# Altium project Sampler.PrjPCB (part 5 of 5)

## Sheet Drivers.SchDoc: =DocumentName
size A3; Version: 3.0.0; Github: https://github.com/sinara-hw/Sampler; Last modified by: Krzysztof Belewicz; DocumentNumber: 1; Revision: 0; SheetNumber: 1; SheetTotal: 1
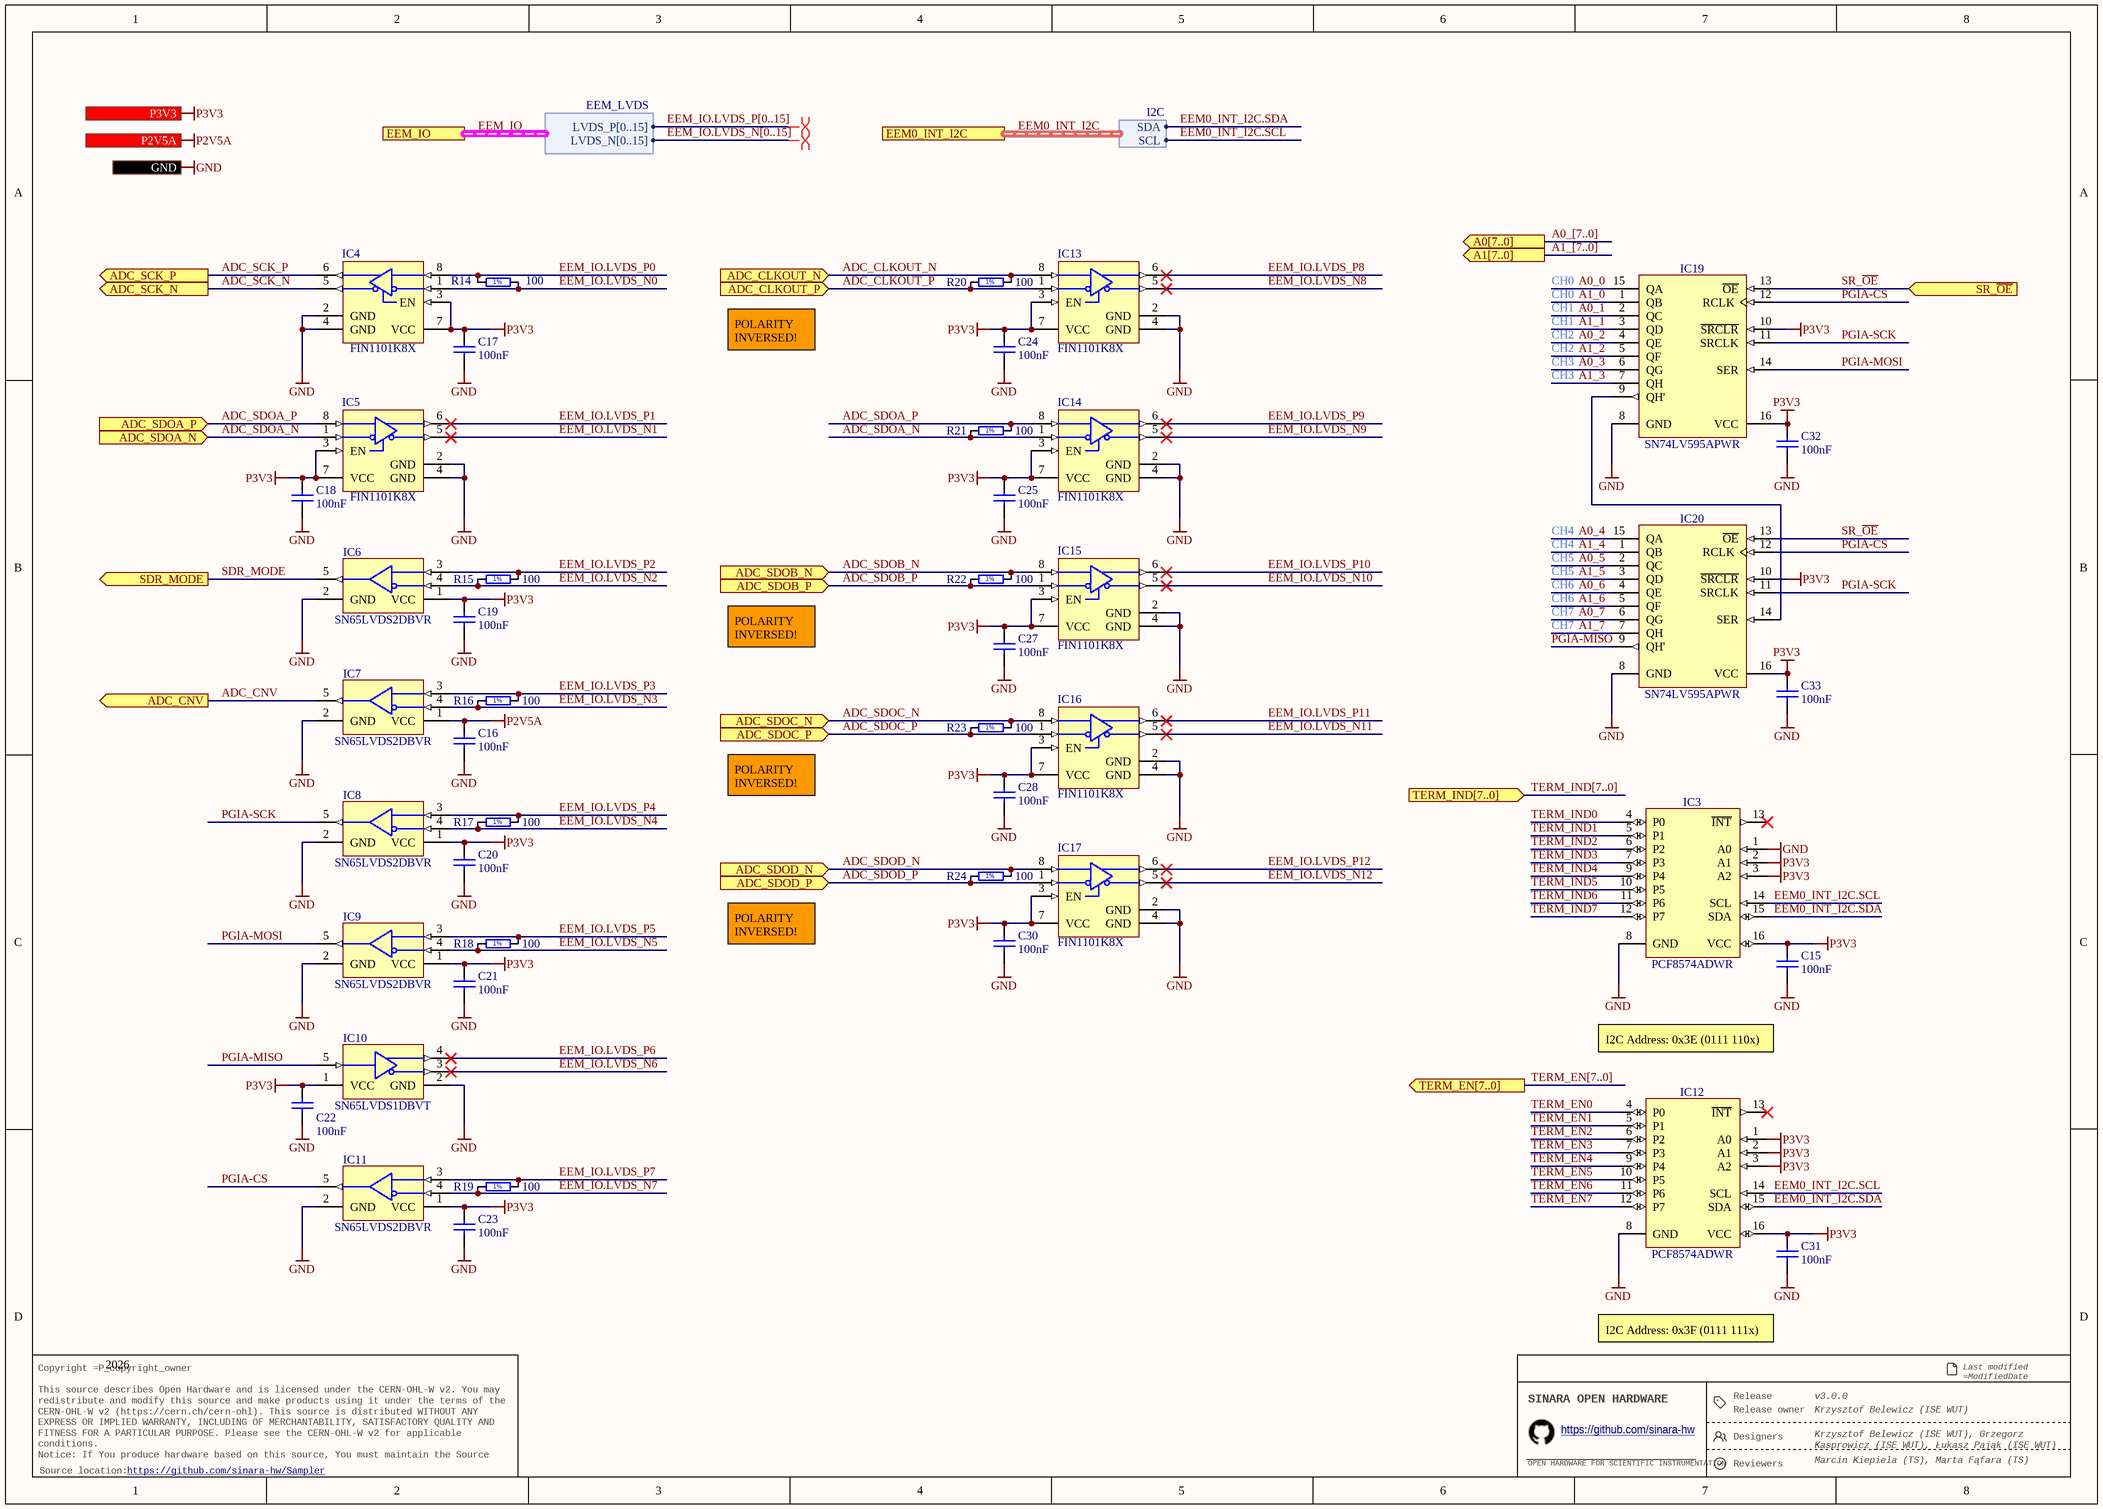
[diagram p13: Drivers.SchDoc]

### Parts
C15  100nF  [CAPC1005X55N]
C16  100nF  [CAPC1005X55N]
C17  100nF  [CAPC1005X55N]
C18  100nF  [CAPC1005X55N]
C19  100nF  [CAPC1005X55N]
C20  100nF  [CAPC1005X55N]
C21  100nF  [CAPC1005X55N]
C22  100nF  [CAPC1005X55N]
C23  100nF  [CAPC1005X55N]
C24  100nF  [CAPC1005X55N]
C25  100nF  [CAPC1005X55N]
C27  100nF  [CAPC1005X55N]
C28  100nF  [CAPC1005X55N]
C30  100nF  [CAPC1005X55N]
C31  100nF  [CAPC1005X55N]
C32  100nF  [CAPC1005X55N]
C33  100nF  [CAPC1005X55N]
IC3  PCF8574ADWR  [SOIC127P1030X265-16N]
IC4  FIN1101K8X  [SOP50P310X90-8N]
IC5  FIN1101K8X  [SOP50P310X90-8N]
IC6  SN65LVDS2DBVR  [SOT95P280X145-5N]
IC7  SN65LVDS2DBVR  [SOT95P280X145-5N]
IC8  SN65LVDS2DBVR  [SOT95P280X145-5N]
IC9  SN65LVDS2DBVR  [SOT95P280X145-5N]
IC10  SN65LVDS1DBVT  [SOT95P280X145-5N]
IC11  SN65LVDS2DBVR  [SOT95P280X145-5N]
IC12  PCF8574ADWR  [SOIC127P1030X265-16N]
IC13  FIN1101K8X  [SOP50P310X90-8N]
IC14  FIN1101K8X  [SOP50P310X90-8N]
IC15  FIN1101K8X  [SOP50P310X90-8N]
IC16  FIN1101K8X  [SOP50P310X90-8N]
IC17  FIN1101K8X  [SOP50P310X90-8N]
IC19  SN74LV595APWR  [SOP65P640X120-16N]
IC20  SN74LV595APWR  [SOP65P640X120-16N]
R14  100  [RESC1005X40N]
R15  100  [RESC1005X40N]
R16  100  [RESC1005X40N]
R17  100  [RESC1005X40N]
R18  100  [RESC1005X40N]
R19  100  [RESC1005X40N]
R20  100  [RESC1005X40N]
R21  100  [RESC1005X40N]
R22  100  [RESC1005X40N]
R23  100  [RESC1005X40N]
R24  100  [RESC1005X40N]

### Ports
A0[7..0] (out), A1[7..0] (out), ADC_CLKOUT_N (in), ADC_CLKOUT_P (in), ADC_CNV (out), ADC_SCK_N (out), ADC_SCK_P (out), ADC_SDOA_N (in), ADC_SDOA_P (in), ADC_SDOB_N (in), ADC_SDOB_P (in), ADC_SDOC_N (in), ADC_SDOC_P (in), ADC_SDOD_N (in), ADC_SDOD_P (in), EEM0_INT_I2C (harness I2C), EEM_IO (harness EEM_LVDS), GND, P2V5A (in), P3V3 (in), SDR_MODE (out), SR_~{OE} (in), TERM_EN[7..0] (out), TERM_IND[7..0] (in)

### Harnesses
EEM_LVDS: LVDS_P[0..15], LVDS_N[0..15]
I2C: SDA, SCL

### Nets
GND: C15.1 C16.1 C17.1 C18.1 C19.1 C20.1 C21.1 C22.1 C23.1 C24.1 C25.1 C27.1 C28.1 C30.1 C31.1 C32.1 C33.1 IC3.1(A0) IC3.8(GND) IC4.2(GND) IC4.4(GND) IC5.2(GND) IC5.4(GND) IC6.2(GND) IC7.2(GND) IC8.2(GND) IC9.2(GND) IC10.2(GND) IC11.2(GND) IC12.8(GND) IC13.2(GND) IC13.4(GND) IC14.2(GND) IC14.4(GND) IC15.2(GND) IC15.4(GND) IC16.2(GND) IC16.4(GND) IC17.2(GND) IC17.4(GND) IC19.8(GND) IC20.8(GND) ; port GND
P2V5A: C16.2 IC7.1(VCC) ; port P2V5A
P3V3: C15.2 C17.2 C18.2 C19.2 C20.2 C21.2 C22.2 C23.2 C24.2 C25.2 C27.2 C28.2 C30.2 C31.2 C32.2 C33.2 IC3.2(A1) IC3.3(A2) IC3.16(VCC) IC4.3(EN) IC4.7(VCC) IC5.3(EN) IC5.7(VCC) IC6.1(VCC) IC8.1(VCC) IC9.1(VCC) IC10.1(VCC) IC11.1(VCC) IC12.1(A0) IC12.2(A1) IC12.3(A2) IC12.16(VCC) IC13.3(EN) IC13.7(VCC) IC14.3(EN) IC14.7(VCC) IC15.3(EN) IC15.7(VCC) IC16.3(EN) IC16.7(VCC) IC17.3(EN) IC17.7(VCC) IC19.10(~{SRCLR}) IC19.16(VCC) IC20.10(~{SRCLR}) IC20.16(VCC) ; port P3V3
A0_0: IC19.15(QA)  [project net A00]
A0_1: IC19.2(QC)  [project net A01]
A0_2: IC19.4(QE)  [project net A02]
A0_3: IC19.6(QG)  [project net A03]
A0_4: IC20.15(QA)  [project net A04]
A0_5: IC20.2(QC)  [project net A05]
A0_6: IC20.4(QE)  [project net A06]
A0_7: IC20.6(QG)  [project net A07]
A1_0: IC19.1(QB)  [project net A10]
A1_1: IC19.3(QD)  [project net A11]
A1_2: IC19.5(QF)  [project net A12]
A1_3: IC19.7(QH)  [project net A13]
A1_4: IC20.1(QB)  [project net A14]
A1_5: IC20.3(QD)  [project net A15]
A1_6: IC20.5(QF)  [project net A16]
A1_7: IC20.7(QH)  [project net A17]
ADC_CLKOUT_N: IC13.8(RIN+) R20.2 ; port ADC_CLKOUT_N
ADC_CLKOUT_P: IC13.1(RIN-) R20.1 ; port ADC_CLKOUT_P
ADC_CNV: IC7.5(R) ; port ADC_CNV
ADC_SCK_N: IC4.5(DOUT-) ; port ADC_SCK_N
ADC_SCK_P: IC4.6(DOUT+) ; port ADC_SCK_P
ADC_SDOA_N: IC5.1(RIN-) IC14.1(RIN-) R21.1 ; port ADC_SDOA_N
ADC_SDOA_P: IC5.8(RIN+) IC14.8(RIN+) R21.2 ; port ADC_SDOA_P
ADC_SDOB_N: IC15.8(RIN+) R22.2 ; port ADC_SDOB_N
ADC_SDOB_P: IC15.1(RIN-) R22.1 ; port ADC_SDOB_P
ADC_SDOC_N: IC16.8(RIN+) R23.2 ; port ADC_SDOC_N
ADC_SDOC_P: IC16.1(RIN-) R23.1 ; port ADC_SDOC_P
ADC_SDOD_N: IC17.8(RIN+) R24.2 ; port ADC_SDOD_N
ADC_SDOD_P: IC17.1(RIN-) R24.1 ; port ADC_SDOD_P
EEM0_INT_I2C.SCL: IC3.14(SCL) IC12.14(SCL) ; port EEM0_INT_I2C.SCL
EEM0_INT_I2C.SDA: IC3.15(SDA) IC12.15(SDA) ; port EEM0_INT_I2C.SDA
EEM_IO.LVDS_N0: IC4.1(RIN-) R14.1
EEM_IO.LVDS_N1: IC5.5(DOUT-)
EEM_IO.LVDS_N2: IC6.4(B) R15.1
EEM_IO.LVDS_N3: IC7.4(B) R16.1
EEM_IO.LVDS_N4: IC8.4(B) R17.1
EEM_IO.LVDS_N5: IC9.4(B) R18.1
EEM_IO.LVDS_N6: IC10.3(A)
EEM_IO.LVDS_N7: IC11.4(B) R19.1
EEM_IO.LVDS_N8: IC13.5(DOUT-)
EEM_IO.LVDS_N9: IC14.5(DOUT-)
EEM_IO.LVDS_N10: IC15.5(DOUT-)
EEM_IO.LVDS_N11: IC16.5(DOUT-)
EEM_IO.LVDS_N12: IC17.5(DOUT-)
EEM_IO.LVDS_P0: IC4.8(RIN+) R14.2
EEM_IO.LVDS_P1: IC5.6(DOUT+)
EEM_IO.LVDS_P2: IC6.3(A) R15.2
EEM_IO.LVDS_P3: IC7.3(A) R16.2
EEM_IO.LVDS_P4: IC8.3(A) R17.2
EEM_IO.LVDS_P5: IC9.3(A) R18.2
EEM_IO.LVDS_P6: IC10.4(B)
EEM_IO.LVDS_P7: IC11.3(A) R19.2
EEM_IO.LVDS_P8: IC13.6(DOUT+)
EEM_IO.LVDS_P9: IC14.6(DOUT+)
EEM_IO.LVDS_P10: IC15.6(DOUT+)
EEM_IO.LVDS_P11: IC16.6(DOUT+)
EEM_IO.LVDS_P12: IC17.6(DOUT+)
PGIA-CS: IC11.5(R) IC19.12(RCLK) IC20.12(RCLK)
PGIA-MISO: IC10.5(R) IC20.9(QH')
PGIA-MOSI: IC9.5(R) IC19.14(SER)
PGIA-SCK: IC8.5(R) IC19.11(SRCLK) IC20.11(SRCLK)
SDR_MODE: IC6.5(R) ; port SDR_MODE
SR_~{OE}: IC19.13(~{OE}) IC20.13(~{OE}) ; port SR_~{OE}
TERM_EN0: IC12.4(P0)
TERM_EN1: IC12.5(P1)
TERM_EN2: IC12.6(P2)
TERM_EN3: IC12.7(P3)
TERM_EN4: IC12.9(P4)
TERM_EN5: IC12.10(P5)
TERM_EN6: IC12.11(P6)
TERM_EN7: IC12.12(P7)
TERM_IND0: IC3.4(P0)
TERM_IND1: IC3.5(P1)
TERM_IND2: IC3.6(P2)
TERM_IND3: IC3.7(P3)
TERM_IND4: IC3.9(P4)
TERM_IND5: IC3.10(P5)
TERM_IND6: IC3.11(P6)
TERM_IND7: IC3.12(P7)
NetIC19_9: IC19.9(QH') IC20.14(SER)

Not connected (* = marked no-connect by the designer): IC3 13(~{INT})*; IC12 13(~{INT})*

### Buses and harness runs
bus A0_[7..0] = port A0[7..0]
bus A1_[7..0] = port A1[7..0]
bus EEM_IO.LVDS_N[0..15]
bus EEM_IO.LVDS_P[0..15]
bus TERM_EN[7..0] = port TERM_EN[7..0]
bus TERM_IND[7..0] = port TERM_IND[7..0]
harness EEM0_INT_I2C = port EEM0_INT_I2C
harness EEM_IO = port EEM_IO

### Layout directives
differential pair; differential pair class Diff_100Ohm: (no net found under the mark)

### Notes on the sheet
- CH0
- CH1
- POLARITY INVERSED!
- CH2
- CH3
- CH4
- CH5
- CH6
- CH7
- I2C Address: 0x3E (0111 110x)
- 2026
- I2C Address: 0x3F (0111 111x)
- Release
- Last modified =ModifiedDate
  Sheet =sheetnumber of =sheettotal · Size A3
- Copyright =P_copyright_owner
  This source describes Open Hardware and is licensed under the CERN-OHL-W v2. You may redistribute and modify this source and make products using it under the terms of the CERN-OHL-W v2 (https://cern.ch/cern-ohl). This source is distributed WITHOUT ANY EXPRESS OR IMPLIED WARRANTY, INCLUDING OF MERCHANTABILITY, SATISFACTORY QUALITY AND FITNESS FOR A PARTICULAR PURPOSE. Please see the CERN-OHL-W v2 for applicable conditions.
  Notice: If You produce hardware based on this source, You must maintain the Source Location visible on the product, its packaging or its documentation.
- SINARA OPEN HARDWARE
- OPEN HARDWARE FOR SCIENTIFIC INSTRUMENTATION
- https://github.com/sinara-hw
- Release owner
- Designers
- Reviewers
- Source location:
- (in symbol R0402_100R_1%_0.1W_100PPM) 1%

### Library data of the parts
C15-C25 C27 C28 C30-C33 = CC0402_100NF_50V_10%_X7R: as T_C3-T_C6 on sheet EEM_Connectors; Part Number: CC0402_100NF_50V_10%_X7R; Component Kind: Standard; Component Type: Standard; Pin Count: 2; Value: 100nF; Status: None; Manufacturer Part Number: CC0402_100NF_50V_10%_X7R; Case: 0402; Mounted: Yes; Socket: No; SMD: Yes; Sense: No; Manufacturer1 Example: MURATA; Manufacturer1 ComponentHeight: 0.55mm; HelpURL: \\cern.ch\dfs\Applications\Altium\Datasheets\CC0402_MURATA_GRM155R71H104KE14D.pdf; Author: CERN DEM MR; CreateDate: 30.06.2017; LatestRevisionDate: 30.06.2017
IC3 IC12 = PCF8574ADWR: Remote 8-bit I/O Expander For I2C Bus; Manufacturer: TEXAS INSTRUMENTS; PressFit: No; Bonding: No; Part Number: PCF8574ADWR; Component Kind: Standard; Component Type: Standard; Device: PCF8574ADWR; PackageDescription: SOIC, 1.27mm Pitch; 16 Pin, 7.50mm W X 10.3mm L X 2.65mm H body, IPC Medium Density; Part Description: Remote 8-bit I/O Expander For I2C Bus; Manufacturer Part Number: PCF8574ADWR; Pin Count: 16; Case: SOIC16W; Mounted: Yes; Socket: No; SMD: Yes; Sense: No; ComponentHeight: 2.65mm; Author: CERN DEM JLC; HelpURL: \\cern.ch\dfs\Applications\Altium\Datasheets\PCF8574ADWR.pdf; CreateDate: 01/11/2012; LatestRevisionDate: 01/11/2012
IC4 IC5 IC13-IC17 = FIN1101K8X: LVDS Single Port High Speed Repeater; Manufacturer: FAIRCHILD SEMICONDUCTOR; PressFit: No; Bonding: No; Part Number: FIN1101K8X; Component Kind: Standard; Component Type: Standard; Device: FIN1101K8X; PackageDescription: SOP, 0.50mm Pitch; 8 pin, 2.30mm W X 2.00mm L X 0.90mm H body, PC Medium Density; Part Description: LVDS Single Port High Speed Repeater; Manufacturer Part Number: FIN1101K8X; Pin Count: 8; Case: TSSOP8; Mounted: Yes; Socket: No; SMD: Yes; Sense: No; ComponentHeight: 0.8mm; Author: CERN DEM JLC; HelpURL: \\cern.ch\dfs\Applications\Altium\Datasheets\FIN1101K8X.pdf; CreateDate: 08.11.2016; LatestRevisionDate: 08.11.2016
IC6-IC9 IC11 = SN65LVDS2DBVR: High-Speed Differential Line Receiver; Manufacturer: TEXAS INSTRUMENTS; PressFit: No; Bonding: No; Part Number: SN65LVDS2DBVR; Component Kind: Standard; Component Type: Standard; Device: SN65LVDS2DBVR; PackageDescription: SOT, 0.95mm pitch; 5 pin, 1.60mm W X 2.90mm L X 1.45mm H body, IPC Medium Density; Part Description: High-Speed Differential Line Receiver; Manufacturer Part Number: SN65LVDS2DBVR; Pin Count: 5; Case: SOT23-5; Mounted: Yes; Socket: No; SMD: Yes; Sense: No; ComponentHeight: 1.45mm; Author: CERN DEM JLC; HelpURL: \\cern.ch\dfs\Applications\Altium\Datasheets\SN65LVDS2DBVR.pdf; CreateDate: 03.03.2011; LatestRevisionDate: 22.09.2011
IC10 = SN65LVDS1DBVT: High-Speed Differential Line Driver; Manufacturer: TEXAS INSTRUMENTS; PressFit: No; Bonding: No; Part Number: SN65LVDS1DBVT; Component Kind: Standard; Component Type: Standard; Device: SN65LVDS1DBVT; PackageDescription: SOT, 0.95mm pitch; 5 pin, 1.60mm W X 2.90mm L X 1.45mm H body, IPC Medium Density; Part Description: High-Speed Differential Line Driver; Manufacturer Part Number: SN65LVDS1DBVT; Pin Count: 5; Case: SOT23-5; Mounted: Yes; Socket: No; SMD: Yes; Sense: No; ComponentHeight: 1.45mm; Author: CERN DEM JLC; HelpURL: \\cern.ch\dfs\Applications\Altium\Datasheets\SN65LVDS1DBVT.pdf; CreateDate: 22.09.2011; LatestRevisionDate: 22.09.2011
IC19 IC20 = SN74LV595APWR: 8-Bit Shift Register With 3-State Output Register; Part Description: 8-Bit Shift Register With 3-State Output Registers; Manufacturer: TEXAS INSTRUMENTS; PressFit: No; Bonding: No; Part Number: SN74LV595APWR; Component Kind: Standard; Component Type: Standard; Device: SN74LV595APWR; PackageDescription: SOP, 0.65mm pitch; 16 pin, 4.40mm W X 5.00mm L X 1.20mm H body IPC Medium Density; Manufacturer Part Number: SN74LV595APWR; Pin Count: 16; Case: TSSOP16; Mounted: Yes; Socket: No; SMD: Yes; Sense: No; ComponentHeight: 1.2mm; Author: CERN DEM JLC; HelpURL: \\cern.ch\dfs\Applications\Altium\Datasheets\SN74LV595APWR.pdf; CreateDate: 10/05/2012; LatestRevisionDate: 10/05/2012
R14-R24 = R0402_100R_1%_0.1W_100PPM: Resistor - 1%; Part Description: General Purpose Thick Film Chip Resistor; Manufacturer: GENERIC; Manufacturer Part Number: R0402_100R_1%_0.1W_100PPM_50V; Manufacturer1 Part Number: ERJ2RKF1000X; Power: 0.1W; TC: ±100ppm/°C; Voltage: 50V; Part Number: R0402_100R_1%_0.1W_100PPM; Component Kind: Standard; Component Type: Standard; Pin Count: 2; Value: 100; Status: Not recommended; Tolerance: ±1%; Case: 0402; Mounted: Yes; Sense: No; Socket: No; SMD: Yes; Manufacturer1 Example: PANASONIC; Manufacturer1 ComponentHeight: 0.4mm; HelpURL: \\cern.ch\dfs\Applications\Altium\Datasheets\R0402_PANASONIC_ERJ2RK.pdf; Author: CERN DEM JLC; CreateDate: 12.12.2013; LatestRevisionDate: 03.03.2015

## Sheet I2C_switch.SchDoc: =DocumentName
size A4; SPICEModelCacheVGBTAUBO: <root> / <DocumentId>VGBTAUBO</DocumentId> / </root>; Version: 3.0.0; Github: https://github.com/sinara-hw/Sampler; Last modified by: Maciej Przybysz; DocumentNumber: 1; Revision: 0; SheetNumber: 1; SheetTotal: 1
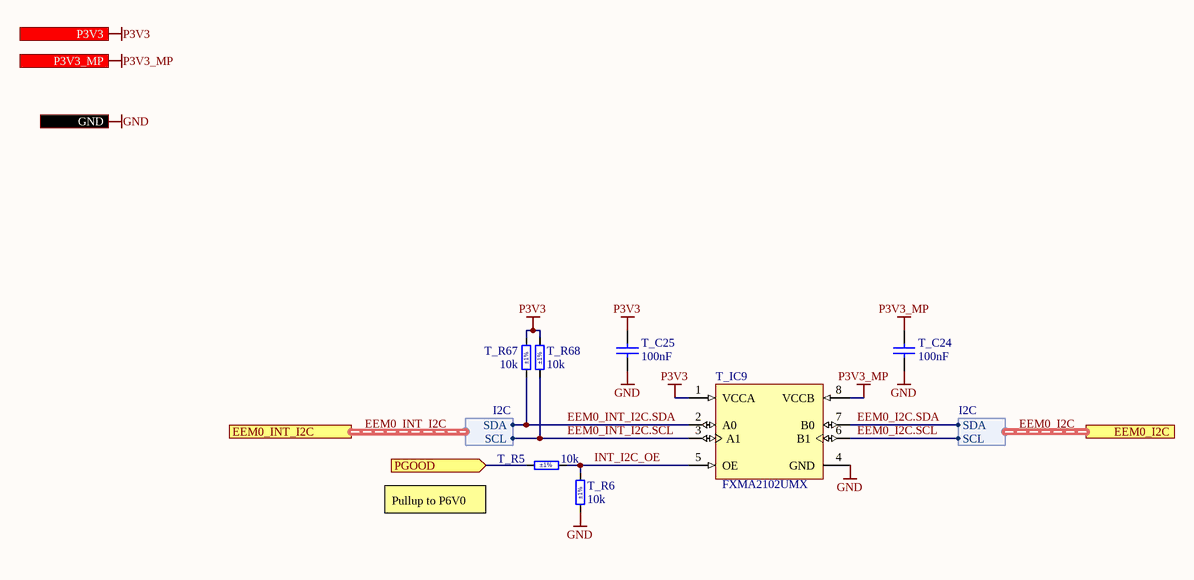
[diagram p14: I2C_switch.SchDoc]

### Parts
T_C24  100nF  [CAPC1005X55N]
T_C25  100nF  [CAPC1005X55N]
T_IC9  FXMA2102UMX  [FXMA2102UMX]
T_R5  10k  Tolerance: ±1%  [RESC1005X40N]
T_R6  10k  Tolerance: ±1%  [RESC1005X40N]
T_R67  10k  Tolerance: ±1%  [RESC1005X40N]
T_R68  10k  Tolerance: ±1%  [RESC1005X40N]

### Ports
EEM0_I2C (harness I2C), EEM0_INT_I2C (harness I2C), GND, P3V3 (in), P3V3_MP (in), PGOOD (in)

### Harnesses
I2C: SDA, SCL

### Nets
GND: T_C24.1 T_C25.1 T_IC9.4(GND) T_R6.1 ; port GND
P3V3: T_C25.2 T_IC9.1(VCCA) T_R67.2 T_R68.2 ; port P3V3
P3V3_MP: T_C24.2 T_IC9.8(VCCB) ; port P3V3_MP
EEM0_I2C.SCL: T_IC9.6(B1) ; port EEM0_I2C.SCL
EEM0_I2C.SDA: T_IC9.7(B0) ; port EEM0_I2C.SDA
EEM0_INT_I2C.SCL: T_IC9.3(A1) T_R68.1 ; port EEM0_INT_I2C.SCL
EEM0_INT_I2C.SDA: T_IC9.2(A0) T_R67.1 ; port EEM0_INT_I2C.SDA
INT_I2C_OE: T_IC9.5(OE) T_R5.2 T_R6.2
PGOOD: T_R5.1 ; port PGOOD

### Buses and harness runs
harness EEM0_I2C = port EEM0_I2C
harness EEM0_INT_I2C = port EEM0_INT_I2C

### Notes on the sheet
- (near T_R5) Pullup to P6V0
- Release
- Last modified =ModifiedDate
  Sheet =sheetnumber of =sheettotal · Size A4
- Copyright =P_copyright_owner
  This source describes Open Hardware and is licensed under the CERN-OHL-W v2. You may redistribute and modify this source and make products using it under the terms of the CERN-OHL-W v2 (https://cern.ch/cern-ohl). This source is distributed WITHOUT ANY EXPRESS OR IMPLIED WARRANTY, INCLUDING OF MERCHANTABILITY, SATISFACTORY QUALITY AND FITNESS FOR A PARTICULAR PURPOSE. Please see the CERN-OHL-W v2 for applicable conditions.
  Notice: If You produce hardware based on this source, You must maintain the Source Location visible on the product, its packaging or its documentation.
- SINARA OPEN HARDWARE
- OPEN HARDWARE FOR SCIENTIFIC INSTRUMENTATION
- https://github.com/sinara-hw
- Release owner
- Designers
- Reviewers
- Source location:

### Library data of the parts
T_C24 T_C25 = CC0402_100NF_50V_10%_X7R: as T_C3-T_C6 on sheet EEM_Connectors; Part Number: CC0402_100NF_50V_10%_X7R; Component Kind: Standard; Component Type: Standard; Pin Count: 2; Value: 100nF; Status: None; Manufacturer Part Number: CC0402_100NF_50V_10%_X7R; Case: 0402; Mounted: Yes; Socket: No; SMD: Yes; Sense: No; Manufacturer1 Example: MURATA; Manufacturer1 ComponentHeight: 0.55mm; HelpURL: \\cern.ch\dfs\Applications\Altium\Datasheets\CC0402_MURATA_GRM155R71H104KE14D.pdf; Author: CERN DEM MR; CreateDate: 30.06.2017; LatestRevisionDate: 30.06.2017
T_IC9 = CMP-015-00014-1: Dual Supply 2-Bit Voltage Translator/Buffer/Repeater Isolator for I2C Applications; Manufacturer: Onsemi; Max Supply Voltage: 5.5V; Min Supply Voltage: 1.65V; Min Operating Temperature: -40°C; Pins: 8; Max Operating Temperature: 85°C; Manufacaturer Part Number: FXMA2102UMX; Mounting Technology: Surface Mount
T_R5 T_R6 T_R67 T_R68 = R0402_10K_1%_0.0625W_100PPM: Resistor - 1%; Part Description: General Purpose Thick Film Chip Resistor; Manufacturer: GENERIC; Manufacturer1 Part Number: 232270671003L; TC: ±100ppm/°C; PressFit: No; Part Number: R0402_10K_1%_0.0625W_100PPM; Component Kind: Standard; Component Type: Standard; Pin Count: 2; Value: 10k; Status: Not Recommended; Power: 0.0625W; Manufacturer Part Number: R0402_10K_1%_0.0625W_100PPM; Case: 0402; Mounted: Yes; Sense: No; Socket: No; SMD: Yes; Manufacturer1 Example: YAGEO PHYCOMP; Manufacturer1 ComponentHeight: 0.4mm; HelpURL: \\cern.ch\dfs\Applications\Altium\Datasheets\R0402_Phycomp_RC0402.pdf; Author: CERN DEM JLC; CreateDate: 03.12.2007; LatestRevisionDate: 17.10.2012

## Sheet PWR_input_connector.SchDoc: =DocumentName
size A4; Version: 3.0.0; Github: https://github.com/sinara-hw/Sampler; Last modified by: Maciej Przybysz; DocumentNumber: 1; Revision: 0; SheetNumber: 1; SheetTotal: 1
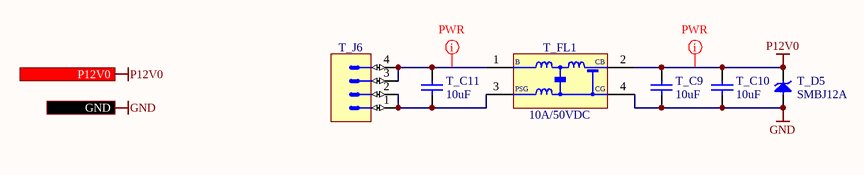
[diagram p15: PWR_input_connector.SchDoc]

### Parts
T_C9  10uF  [CAPC2012X95N]
T_C10  10uF  [CAPC2012X95N]
T_C11  10uF  [CAPC2012X95N]
T_D5  SMBJ12A  [DIOM5336X265N]
T_FL1  10A/50VDC  [FIL_MURATA_BNX02]
T_J6  Mini-Fit Jr.™  [MOLEX_39-30-0040]  (value not drawn)

### Ports
GND, P12V0 (out)

### Nets
GND: T_C9.1 T_C10.1 T_D5.2(A) T_FL1.4(CG) ; port GND
P12V0: T_C9.2 T_C10.2 T_D5.1(C) T_FL1.2(CB) ; port P12V0
NetT_C11_1: T_C11.1 T_FL1.3(PSG) T_J6.1 T_J6.2
NetT_C11_2: T_C11.2 T_FL1.1(B) T_J6.3 T_J6.4

### Layout directives
net class PWR: NetT_C11_2, P12V0

### Notes on the sheet
- Release
- Last modified =ModifiedDate
  Sheet =sheetnumber of =sheettotal · Size A4
- Copyright =P_copyright_owner
  This source describes Open Hardware and is licensed under the CERN-OHL-W v2. You may redistribute and modify this source and make products using it under the terms of the CERN-OHL-W v2 (https://cern.ch/cern-ohl). This source is distributed WITHOUT ANY EXPRESS OR IMPLIED WARRANTY, INCLUDING OF MERCHANTABILITY, SATISFACTORY QUALITY AND FITNESS FOR A PARTICULAR PURPOSE. Please see the CERN-OHL-W v2 for applicable conditions.
  Notice: If You produce hardware based on this source, You must maintain the Source Location visible on the product, its packaging or its documentation.
- SINARA OPEN HARDWARE
- OPEN HARDWARE FOR SCIENTIFIC INSTRUMENTATION
- https://github.com/sinara-hw
- Release owner
- Designers
- Reviewers
- Source location:

### Library data of the parts
T_C9-T_C11 = CC0805_10UF_25V_10%_X5R: Non-polarised capacitor; Part Description: SMD Multilayer Chip Ceramic Capacitor; Manufacturer: GENERIC; Manufacturer1 Part Number: GRM219R61E106KA12D; Voltage: 25V; TC: X5R; Tolerance: ±10%; Part Number: CC0805_10UF_25V_10%_X5R; Component Kind: Standard; Component Type: Standard; Pin Count: 2; Value: 10uF; Status: Preferred; Manufacturer Part Number: CC0805_10UF_25V_10%_X5R; Case: 0805; Mounted: Yes; Socket: No; SMD: Yes; Sense: No; Manufacturer1 Example: MURATA; Manufacturer1 ComponentHeight: 0.95mm; HelpURL: \\cern.ch\dfs\Applications\Altium\Datasheets\CC0805_X5R_MURATA_GRM.pdf; Author: CERN DEM JLC; CreateDate: 25.10.2012; LatestRevisionDate: 06.09.2016
T_D5 = SMBJ12A: Zener Diode; Part Description: Uni-Directional Transient Voltage Suppressor Diode; Manufacturer: FAIRCHILD SEMICONDUCTOR; Voltage: 12V; Power: 600W; PressFit: No; Bonding: No; Part Number: SMBJ12A; Component Kind: Standard; Component Type: Standard; Device: SMBJ12A; PackageDescription: DO-214-AA/SMB Diode, Molded Body; 5.34mm L X 3.625mm W X 2.65mm H, IPC Medium Density; Manufacturer Part Number: SMBJ12A; Pin Count: 2; Case: DO-214AA; Mounted: Yes; Socket: No; SMD: Yes; Sense: No; ComponentHeight: 2.65mm; HelpURL: \\cern.ch\dfs\Applications\Altium\Datasheets\SMBJ.pdf; Author: CERN DEM JLC; CreateDate: 10.04.2013; LatestRevisionDate: 10.04.2013
T_FL1 = FIL_MURATA_BNX022-01L: Block Type EMIFIL (LC Combined); Part Description: Block Type EMIFIL (LC Combined) SMD Type, BNX02* Series; Manufacturer: MURATA; Resistance: 0.5R; Part Number: FIL_MURATA_BNX022-01L; Component Kind: Standard; Component Type: Standard; Pin Count: 2; Value: 10A/50VDC; Status: None; Manufacturer Part Number: BNX022-01L; Mounted: Yes; Socket: No; SMD: Yes; Sense: No; ComponentHeight: 3.3mm; HelpURL: \\cern.ch\dfs\Applications\Altium\Datasheets\FIL_MURATA_BNX022-01L.pdf; Author: CERN DEM JLC; CreateDate: 10.10.2012; LatestRevisionDate: 10.10.2012
T_J6 = MOLEX_39-30-0040: Connector 4 Male; Part Description: 4.20mm (.165") Pitch Mini-Fit Jr. Header, Dual Row, Right Angle with Snap-in Plastic Peg PCB Lock, 4 Circuits; Manufacturer: MOLEX; PressFit: No; Part Number: MOLEX_39-30-0040; Component Kind: Standard; Component Type: Standard; Pin Count: 4; Family: Mini-Fit Jr.™; Mounted: Yes; Socket: No; SMD: No; Sense: No; Status: None; Manufacturer Part Number: 39-30-0040; ComponentHeight: 11.4mm; HelpURL: \\cern.ch\dfs\Applications\Altium\Datasheets\MOLEX_39-30-0040.pdf; Author: CERN DEM JLC; CreateDate: 2018-10-02; LatestRevisionDate: 2018-10-02

## Nets that join several sheets
GND: Power_Supplies (T_C1.1 T_C2.1 T_IC1.2 T_R7.1), Power-up_delay (9 pins), Power_main_DCDC (80 pins), LEDs (20 pins), CPCIS_Connectors_P1_P6 (55 pins), DIOT_signal_routing (T_C22.1 T_C23.1 T_IC8.4), EEM_Connectors (34 pins), Temperature_monitoring (T_C8.1 T_IC6.2 T_R25.1), Mechanical (21 pins), FP_Connectors (12 pins), ADC_8CH (41 pins), U_Input_channel0 (21 pins), U_Input_channel1 (21 pins), U_Input_channel2 (21 pins), U_Input_channel3 (21 pins), U_Input_channel4 (21 pins), U_Input_channel5 (21 pins), U_Input_channel6 (21 pins), U_Input_channel7 (21 pins), Drivers (42 pins), I2C_switch (T_C24.1 T_C25.1 T_IC9.4 T_R6.1), PWR_input_connector (T_C9.1 T_C10.1 T_D5.2 T_FL1.4)
N12V0A: Power_main_DCDC (8 pins), LEDs (LD12.1 TP9.1), ADC_8CH (C105.2 IC35.4), U_Input_channel0 (8 pins), U_Input_channel1 (8 pins), U_Input_channel2 (8 pins), U_Input_channel3 (8 pins), U_Input_channel4 (8 pins), U_Input_channel5 (8 pins), U_Input_channel6 (8 pins), U_Input_channel7 (8 pins)
N13V0: Power_main_DCDC (8 pins), LEDs (LD13.1 TP20.1), FP_Connectors (R42.2)
P2V5A: Power_main_DCDC (7 pins), LEDs (R91.1 TP10.1), ADC_8CH (7 pins), Drivers (C16.2 IC7.1)
P3V3: Power_main_DCDC (10 pins), LEDs (R87.2 TP17.1), FP_Connectors (6 pins), U_Input_channel0 (R25H.2 R27H.2 R29H.2 R31H.2), U_Input_channel1 (R25A.2 R27A.2 R29A.2 R31A.2), U_Input_channel2 (R25B.2 R27B.2 R29B.2 R31B.2), U_Input_channel3 (R25C.2 R27C.2 R29C.2 R31C.2), U_Input_channel4 (R25D.2 R27D.2 R29D.2 R31D.2), U_Input_channel5 (R25E.2 R27E.2 R29E.2 R31E.2), U_Input_channel6 (R25F.2 R27F.2 R29F.2 R31F.2), U_Input_channel7 (R25G.2 R27G.2 R29G.2 R31G.2), Drivers (46 pins), I2C_switch (T_C25.2 T_IC9.1 T_R67.2 T_R68.2)
P3V3_MP: Power_Supplies (T_R2.2 T_R8.2), Power-up_delay (6 pins), LEDs (R89.2 T_R1.2 TP18.1), DIOT_signal_routing (T_C22.2 T_C23.2 T_IC8.1 T_IC8.8), EEM_Connectors (5 pins), Temperature_monitoring (T_C8.2 T_IC6.5), I2C_switch (T_C24.2 T_IC9.8)
P3V3_MP2: LEDs (R90.2 TP19.1), EEM_Connectors (5 pins)
P3V3A: Power_main_DCDC (8 pins), LEDs (R88.2 TP11.1)
P5V0A: Power_main_DCDC (5 pins), LEDs (R85.2 TP13.1), ADC_8CH (10 pins)
P6V0A: Power_main_DCDC (8 pins), LEDs (R84.2 TP12.1)
P12V0: Power_Supplies (T_C1.2 T_IC1.1 T_R4.1), Power-up_delay (T_R29.2), Power_main_DCDC (C29.2 C57.2 IC27.8 L4.1), LEDs (R47.2 T_R3.2 TP2.1), CPCIS_Connectors_P1_P6 (7 pins), EEM_Connectors (T_J1.28 T_J1.29 T_J2.28 T_J2.29), FP_Connectors (R86.2), PWR_input_connector (T_C9.2 T_C10.2 T_D5.1 T_FL1.2)
P12V0A: Power_main_DCDC (6 pins), LEDs (R48.2 TP7.1), ADC_8CH (C104.2 IC35.8), U_Input_channel0 (7 pins), U_Input_channel1 (7 pins), U_Input_channel2 (7 pins), U_Input_channel3 (7 pins), U_Input_channel4 (7 pins), U_Input_channel5 (7 pins), U_Input_channel6 (7 pins), U_Input_channel7 (7 pins)
P13V0: Power_main_DCDC (9 pins), LEDs (R46.2 TP1.1), FP_Connectors (R41.2)
REF_P1V7066: ADC_8CH (IC35.1 R83.2 RN3.3), U_Input_channel0 (R7H.1 RN2H.5 RN2H.8), U_Input_channel1 (R7A.1 RN2A.5 RN2A.8), U_Input_channel2 (R7B.1 RN2B.5 RN2B.8), U_Input_channel3 (R7C.1 RN2C.5 RN2C.8), U_Input_channel4 (R7D.1 RN2D.5 RN2D.8), U_Input_channel5 (R7E.1 RN2E.5 RN2E.8), U_Input_channel6 (R7F.1 RN2F.5 RN2F.8), U_Input_channel7 (R7G.1 RN2G.5 RN2G.8)
REF_P2V048: ADC_8CH (IC35.7 RN3.2 RN4.6), U_Input_channel0 (R13H.1), U_Input_channel1 (R13A.1), U_Input_channel2 (R13B.1), U_Input_channel3 (R13C.1), U_Input_channel4 (R13D.1), U_Input_channel5 (R13E.1), U_Input_channel6 (R13F.1), U_Input_channel7 (R13G.1)
REF_P4V096: Power_main_DCDC (R59.2), LEDs (TP15.1), ADC_8CH (6 pins)
REF_VCC: Power_main_DCDC (7 pins), LEDs (R49.2 TP8.1), ADC_8CH (R80.1)
A00: U_Input_channel0 (IC2H.4), Drivers (IC19.15)
A01: U_Input_channel1 (IC2A.4), Drivers (IC19.2)
A02: U_Input_channel2 (IC2B.4), Drivers (IC19.4)
A03: U_Input_channel3 (IC2C.4), Drivers (IC19.6)
A04: U_Input_channel4 (IC2D.4), Drivers (IC20.15)
A05: U_Input_channel5 (IC2E.4), Drivers (IC20.2)
A06: U_Input_channel6 (IC2F.4), Drivers (IC20.4)
A07: U_Input_channel7 (IC2G.4), Drivers (IC20.6)
A10: U_Input_channel0 (IC2H.5), Drivers (IC19.1)
A11: U_Input_channel1 (IC2A.5), Drivers (IC19.3)
A12: U_Input_channel2 (IC2B.5), Drivers (IC19.5)
A13: U_Input_channel3 (IC2C.5), Drivers (IC19.7)
A14: U_Input_channel4 (IC2D.5), Drivers (IC20.1)
A15: U_Input_channel5 (IC2E.5), Drivers (IC20.3)
A16: U_Input_channel6 (IC2F.5), Drivers (IC20.5)
A17: U_Input_channel7 (IC2G.5), Drivers (IC20.7)
ADC_CLKOUT_N: ADC_8CH (IC36.34), Drivers (IC13.8 R20.2)
ADC_CLKOUT_P: ADC_8CH (IC36.33), Drivers (IC13.1 R20.1)
ADC_CNV: ADC_8CH (IC36.24), Drivers (IC7.5)
ADC_IN_N0: ADC_8CH (IC36.47), U_Input_channel0 (C4H.2 C6H.2 R6H.2)
ADC_IN_N1: ADC_8CH (IC36.50), U_Input_channel1 (C4A.2 C6A.2 R6A.2)
ADC_IN_N2: ADC_8CH (IC36.1), U_Input_channel2 (C4B.2 C6B.2 R6B.2)
ADC_IN_N3: ADC_8CH (IC36.4), U_Input_channel3 (C4C.2 C6C.2 R6C.2)
ADC_IN_N4: ADC_8CH (IC36.10), U_Input_channel4 (C4D.2 C6D.2 R6D.2)
ADC_IN_N5: ADC_8CH (IC36.13), U_Input_channel5 (C4E.2 C6E.2 R6E.2)
ADC_IN_N6: ADC_8CH (IC36.16), U_Input_channel6 (C4F.2 C6F.2 R6F.2)
ADC_IN_N7: ADC_8CH (IC36.19), U_Input_channel7 (C4G.2 C6G.2 R6G.2)
ADC_IN_P0: ADC_8CH (IC36.48), U_Input_channel0 (C6H.1 C7H.1 R12H.2)
ADC_IN_P1: ADC_8CH (IC36.51), U_Input_channel1 (C6A.1 C7A.1 R12A.2)
ADC_IN_P2: ADC_8CH (IC36.2), U_Input_channel2 (C6B.1 C7B.1 R12B.2)
ADC_IN_P3: ADC_8CH (IC36.5), U_Input_channel3 (C6C.1 C7C.1 R12C.2)
ADC_IN_P4: ADC_8CH (IC36.11), U_Input_channel4 (C6D.1 C7D.1 R12D.2)
ADC_IN_P5: ADC_8CH (IC36.14), U_Input_channel5 (C6E.1 C7E.1 R12E.2)
ADC_IN_P6: ADC_8CH (IC36.17), U_Input_channel6 (C6F.1 C7F.1 R12F.2)
ADC_IN_P7: ADC_8CH (IC36.20), U_Input_channel7 (C6G.1 C7G.1 R12G.2)
ADC_SCK_N: ADC_8CH (IC36.42 R79.1), Drivers (IC4.5)
ADC_SCK_P: ADC_8CH (IC36.41 R79.2), Drivers (IC4.6)
ADC_SDOA_N: ADC_8CH (IC36.28), Drivers (IC5.1 IC14.1 R21.1)
ADC_SDOA_P: ADC_8CH (IC36.27), Drivers (IC5.8 IC14.8 R21.2)
ADC_SDOB_N: ADC_8CH (IC36.30), Drivers (IC15.8 R22.2)
ADC_SDOB_P: ADC_8CH (IC36.29), Drivers (IC15.1 R22.1)
ADC_SDOC_N: ADC_8CH (IC36.36), Drivers (IC16.8 R23.2)
ADC_SDOC_P: ADC_8CH (IC36.35), Drivers (IC16.1 R23.1)
ADC_SDOD_N: ADC_8CH (IC36.40), Drivers (IC17.8 R24.2)
ADC_SDOD_P: ADC_8CH (IC36.39), Drivers (IC17.1 R24.1)
BP_I2C.SCL: CPCIS_Connectors_P1_P6 (T_D2.3 T_J4.B2), DIOT_signal_routing (T_IC8.6)
BP_I2C.SDA: CPCIS_Connectors_P1_P6 (T_D2.1 T_J4.C2), DIOT_signal_routing (T_IC8.7)
BP_IO.LVDS_N0: CPCIS_Connectors_P1_P6 (T_J4.E3), DIOT_signal_routing (T_R51.1)
BP_IO.LVDS_N1: CPCIS_Connectors_P1_P6 (T_J4.B3), DIOT_signal_routing (T_R52.1)
BP_IO.LVDS_N2: CPCIS_Connectors_P1_P6 (T_J4.C4), DIOT_signal_routing (T_R53.1)
BP_IO.LVDS_N3: CPCIS_Connectors_P1_P6 (T_J4.L4), DIOT_signal_routing (T_R54.1)
BP_IO.LVDS_N4: CPCIS_Connectors_P1_P6 (T_J4.I4), DIOT_signal_routing (T_R55.1)
BP_IO.LVDS_N5: CPCIS_Connectors_P1_P6 (T_J4.K5), DIOT_signal_routing (T_R56.1)
BP_IO.LVDS_N6: CPCIS_Connectors_P1_P6 (T_J4.H5), DIOT_signal_routing (T_R57.1)
BP_IO.LVDS_N7: CPCIS_Connectors_P1_P6 (T_J4.F6), DIOT_signal_routing (T_R58.1)
BP_IO.LVDS_N8: CPCIS_Connectors_P1_P6 (T_J4.C6), DIOT_signal_routing (T_R59.1)
BP_IO.LVDS_N9: CPCIS_Connectors_P1_P6 (T_J4.L6), DIOT_signal_routing (T_R60.1)
BP_IO.LVDS_N10: CPCIS_Connectors_P1_P6 (T_J4.I6), DIOT_signal_routing (T_R61.1)
BP_IO.LVDS_N11: CPCIS_Connectors_P1_P6 (T_J5.E1), DIOT_signal_routing (T_R62.1)
BP_IO.LVDS_N12: CPCIS_Connectors_P1_P6 (T_J5.B1), DIOT_signal_routing (T_R63.1)
BP_IO.LVDS_P0: CPCIS_Connectors_P1_P6 (T_J4.D3), DIOT_signal_routing (T_R35.1)
BP_IO.LVDS_P1: CPCIS_Connectors_P1_P6 (T_J4.A3), DIOT_signal_routing (T_R36.1)
BP_IO.LVDS_P2: CPCIS_Connectors_P1_P6 (T_J4.B4), DIOT_signal_routing (T_R37.1)
BP_IO.LVDS_P3: CPCIS_Connectors_P1_P6 (T_J4.K4), DIOT_signal_routing (T_R38.1)
BP_IO.LVDS_P4: CPCIS_Connectors_P1_P6 (T_J4.H4), DIOT_signal_routing (T_R39.1)
BP_IO.LVDS_P5: CPCIS_Connectors_P1_P6 (T_J4.J5), DIOT_signal_routing (T_R40.1)
BP_IO.LVDS_P6: CPCIS_Connectors_P1_P6 (T_J4.G5), DIOT_signal_routing (T_R41.1)
BP_IO.LVDS_P7: CPCIS_Connectors_P1_P6 (T_J4.E6), DIOT_signal_routing (T_R42.1)
BP_IO.LVDS_P8: CPCIS_Connectors_P1_P6 (T_J4.B6), DIOT_signal_routing (T_R43.1)
BP_IO.LVDS_P9: CPCIS_Connectors_P1_P6 (T_J4.K6), DIOT_signal_routing (T_R44.1)
BP_IO.LVDS_P10: CPCIS_Connectors_P1_P6 (T_J4.H6), DIOT_signal_routing (T_R45.1)
BP_IO.LVDS_P11: CPCIS_Connectors_P1_P6 (T_J5.D1), DIOT_signal_routing (T_R46.1)
BP_IO.LVDS_P12: CPCIS_Connectors_P1_P6 (T_J5.A1), DIOT_signal_routing (T_R47.1)
EEM0_I2C.SCL: DIOT_signal_routing (T_IC8.3), EEM_Connectors (T_D1.3 T_IC2.1 T_IC3.6 T_J1.27), Temperature_monitoring (T_IC6.1), I2C_switch (T_IC9.6)
EEM0_I2C.SDA: DIOT_signal_routing (T_IC8.2), EEM_Connectors (T_D1.1 T_IC2.3 T_IC3.5 T_J1.26), Temperature_monitoring (T_IC6.6), I2C_switch (T_IC9.7)
EEM0_INT_I2C.SCL: Drivers (IC3.14 IC12.14), I2C_switch (T_IC9.3 T_R68.1)
EEM0_INT_I2C.SDA: Drivers (IC3.15 IC12.15), I2C_switch (T_IC9.2 T_R67.1)
EEM_IO.LVDS_N0: DIOT_signal_routing (T_R51.2), EEM_Connectors (T_J1.3), Drivers (IC4.1 R14.1)
EEM_IO.LVDS_N1: DIOT_signal_routing (T_R52.2), EEM_Connectors (T_J1.6), Drivers (IC5.5)
EEM_IO.LVDS_N2: DIOT_signal_routing (T_R53.2), EEM_Connectors (T_J1.9), Drivers (IC6.4 R15.1)
EEM_IO.LVDS_N3: DIOT_signal_routing (T_R54.2), EEM_Connectors (T_J1.12), Drivers (IC7.4 R16.1)
EEM_IO.LVDS_N4: DIOT_signal_routing (T_R55.2), EEM_Connectors (T_J1.15), Drivers (IC8.4 R17.1)
EEM_IO.LVDS_N5: DIOT_signal_routing (T_R56.2), EEM_Connectors (T_J1.18), Drivers (IC9.4 R18.1)
EEM_IO.LVDS_N6: DIOT_signal_routing (T_R57.2), EEM_Connectors (T_J1.21), Drivers (IC10.3)
EEM_IO.LVDS_N7: DIOT_signal_routing (T_R58.2), EEM_Connectors (T_J1.24), Drivers (IC11.4 R19.1)
EEM_IO.LVDS_N8: DIOT_signal_routing (T_R59.2), EEM_Connectors (T_J2.3), Drivers (IC13.5)
EEM_IO.LVDS_N9: DIOT_signal_routing (T_R60.2), EEM_Connectors (T_J2.6), Drivers (IC14.5)
EEM_IO.LVDS_N10: DIOT_signal_routing (T_R61.2), EEM_Connectors (T_J2.9), Drivers (IC15.5)
EEM_IO.LVDS_N11: DIOT_signal_routing (T_R62.2), EEM_Connectors (T_J2.12), Drivers (IC16.5)
EEM_IO.LVDS_N12: DIOT_signal_routing (T_R63.2), EEM_Connectors (T_J2.15), Drivers (IC17.5)
EEM_IO.LVDS_P0: DIOT_signal_routing (T_R35.2), EEM_Connectors (T_J1.2), Drivers (IC4.8 R14.2)
EEM_IO.LVDS_P1: DIOT_signal_routing (T_R36.2), EEM_Connectors (T_J1.5), Drivers (IC5.6)
EEM_IO.LVDS_P2: DIOT_signal_routing (T_R37.2), EEM_Connectors (T_J1.8), Drivers (IC6.3 R15.2)
EEM_IO.LVDS_P3: DIOT_signal_routing (T_R38.2), EEM_Connectors (T_J1.11), Drivers (IC7.3 R16.2)
EEM_IO.LVDS_P4: DIOT_signal_routing (T_R39.2), EEM_Connectors (T_J1.14), Drivers (IC8.3 R17.2)
EEM_IO.LVDS_P5: DIOT_signal_routing (T_R40.2), EEM_Connectors (T_J1.17), Drivers (IC9.3 R18.2)
EEM_IO.LVDS_P6: DIOT_signal_routing (T_R41.2), EEM_Connectors (T_J1.20), Drivers (IC10.4)
EEM_IO.LVDS_P7: DIOT_signal_routing (T_R42.2), EEM_Connectors (T_J1.23), Drivers (IC11.3 R19.2)
EEM_IO.LVDS_P8: DIOT_signal_routing (T_R43.2), EEM_Connectors (T_J2.2), Drivers (IC13.6)
EEM_IO.LVDS_P9: DIOT_signal_routing (T_R44.2), EEM_Connectors (T_J2.5), Drivers (IC14.6)
EEM_IO.LVDS_P10: DIOT_signal_routing (T_R45.2), EEM_Connectors (T_J2.8), Drivers (IC15.6)
EEM_IO.LVDS_P11: DIOT_signal_routing (T_R46.2), EEM_Connectors (T_J2.11), Drivers (IC16.6)
EEM_IO.LVDS_P12: DIOT_signal_routing (T_R47.2), EEM_Connectors (T_J2.14), Drivers (IC17.6)
GA0: Power-up_delay (T_R31.1 T_T2.1), CPCIS_Connectors_P1_P6 (T_R13.1)
GA1: Power-up_delay (T_R32.1 T_T3.1), CPCIS_Connectors_P1_P6 (T_R14.1)
GA2: Power-up_delay (T_R33.1 T_T4.1), CPCIS_Connectors_P1_P6 (T_R16.1)
GA3: Power-up_delay (T_R34.1 T_T5.1), CPCIS_Connectors_P1_P6 (T_R18.1)
IN_N0: FP_Connectors (P1.2 P5.23), U_Input_channel0 (IC18H.4 L1H.2 R8H.1 SW1H.1)
IN_N1: FP_Connectors (J4.2 P5.20), U_Input_channel1 (IC18A.4 L1A.2 R8A.1 SW1A.1)
IN_N2: FP_Connectors (P1.6 P5.17), U_Input_channel2 (IC18B.4 L1B.2 R8B.1 SW1B.1)
IN_N3: FP_Connectors (J5.2 P5.14), U_Input_channel3 (IC18C.4 L1C.2 R8C.1 SW1C.1)
IN_N4: FP_Connectors (P2.2 P5.11), U_Input_channel4 (IC18D.4 L1D.2 R8D.1 SW1D.1)
IN_N5: FP_Connectors (J6.2 P5.8), U_Input_channel5 (IC18E.4 L1E.2 R8E.1 SW1E.1)
IN_N6: FP_Connectors (P2.6 P5.5), U_Input_channel6 (IC18F.4 L1F.2 R8F.1 SW1F.1)
IN_N7: FP_Connectors (J7.2 P5.2), U_Input_channel7 (IC18G.4 L1G.2 R8G.1 SW1G.1)
IN_P0: FP_Connectors (P1.1 P5.22), U_Input_channel0 (L1H.1 R1H.1 R5H.2)
IN_P1: FP_Connectors (J4.1 P5.19), U_Input_channel1 (L1A.1 R1A.1 R5A.2)
IN_P2: FP_Connectors (P1.5 P5.16), U_Input_channel2 (L1B.1 R1B.1 R5B.2)
IN_P3: FP_Connectors (J5.1 P5.13), U_Input_channel3 (L1C.1 R1C.1 R5C.2)
IN_P4: FP_Connectors (P2.1 P5.10), U_Input_channel4 (L1D.1 R1D.1 R5D.2)
IN_P5: FP_Connectors (J6.1 P5.7), U_Input_channel5 (L1E.1 R1E.1 R5E.2)
IN_P6: FP_Connectors (P2.5 P5.4), U_Input_channel6 (L1F.1 R1F.1 R5F.2)
IN_P7: FP_Connectors (J7.1 P5.1), U_Input_channel7 (L1G.1 R1G.1 R5G.2)
PGOOD: Power_main_DCDC (R157.2), LEDs (T_T1.1), I2C_switch (T_R5.1)
PSU_EN: Power_Supplies (T_R8.1), Power-up_delay (T_IC7.1), Power_main_DCDC (IC31.3), LEDs (LD14.3), Temperature_monitoring (T_IC6.3)
REF_~{SHD}N: Power_main_DCDC (D10.1 IC28.7 R69.1 R157.1), ADC_8CH (IC33.1 IC34.1)
RSTn: Power-up_delay (T_D6.1), CPCIS_Connectors_P1_P6 (T_R15.1)
SDR_MODE: ADC_8CH (T9.1), Drivers (IC6.5)
SERVMOD_3V3: CPCIS_Connectors_P1_P6 (T_R17.1 T_R19.2), DIOT_signal_routing (T_IC8.5)
SR_~{OE}: Power_main_DCDC (IC27.7 R65.1), Drivers (IC19.13 IC20.13)
TERM_EN0: U_Input_channel0 (R33H.2 T2H.1), Drivers (IC12.4)
TERM_EN1: U_Input_channel1 (R33A.2 T2A.1), Drivers (IC12.5)
TERM_EN2: U_Input_channel2 (R33B.2 T2B.1), Drivers (IC12.6)
TERM_EN3: U_Input_channel3 (R33C.2 T2C.1), Drivers (IC12.7)
TERM_EN4: U_Input_channel4 (R33D.2 T2D.1), Drivers (IC12.9)
TERM_EN5: U_Input_channel5 (R33E.2 T2E.1), Drivers (IC12.10)
TERM_EN6: U_Input_channel6 (R33F.2 T2F.1), Drivers (IC12.11)
TERM_EN7: U_Input_channel7 (R33G.2 T2G.1), Drivers (IC12.12)
TERM_IND0: U_Input_channel0 (R27H.1 T1H.3), Drivers (IC3.4)
TERM_IND1: U_Input_channel1 (R27A.1 T1A.3), Drivers (IC3.5)
TERM_IND2: U_Input_channel2 (R27B.1 T1B.3), Drivers (IC3.6)
TERM_IND3: U_Input_channel3 (R27C.1 T1C.3), Drivers (IC3.7)
TERM_IND4: U_Input_channel4 (R27D.1 T1D.3), Drivers (IC3.9)
TERM_IND5: U_Input_channel5 (R27E.1 T1E.3), Drivers (IC3.10)
TERM_IND6: U_Input_channel6 (R27F.1 T1F.3), Drivers (IC3.11)
TERM_IND7: U_Input_channel7 (R27G.1 T1G.3), Drivers (IC3.12)
TERM_LEDn0: FP_Connectors (R26.2), U_Input_channel0 (5 pins)
TERM_LEDn1: FP_Connectors (R28.2), U_Input_channel1 (5 pins)
TERM_LEDn2: FP_Connectors (R30.2), U_Input_channel2 (5 pins)
TERM_LEDn3: FP_Connectors (R32.2), U_Input_channel3 (5 pins)
TERM_LEDn4: FP_Connectors (R34.2), U_Input_channel4 (5 pins)
TERM_LEDn5: FP_Connectors (R37.2), U_Input_channel5 (5 pins)
TERM_LEDn6: FP_Connectors (R38.2), U_Input_channel6 (5 pins)
TERM_LEDn7: FP_Connectors (R40.2), U_Input_channel7 (5 pins)

## Assembly variants
EEM: not fitted C6A C6B C6C C6D C6E C6F C6G C6H C42 C46 C75 CLIP1 CLIP2 CLIP3 CLIP4 CLIP5 CLIP6 CLIP7 CLIP8 CLIP9 CLIP10 CLIP11 CLIP12 CLIP13 CLIP14 CLIP15 CLIP16 CLIP17 CLIP18 IC23 IC24 IC30 IC34 R1A R1B R1C R1D R1E R1F R1G R1H R8A R8B R8C R8D R8E R8F R8G R8H R41 R42 R56 R86 T_IC3 T_IC5 T_J4 T_J5 T_R2 T_R4 T_R35 T_R36 T_R37 T_R38 T_R39 T_R40 T_R41 T_R42 T_R43 T_R44 T_R45 T_R46 T_R47 T_R51 T_R52 T_R53 T_R54 T_R55 T_R56 T_R57 T_R58 T_R59 T_R60 T_R61 T_R62 T_R63; alternate parts T_R26 -> R0805_0R_JUMPER
DIOT: not fitted C6A C6B C6C C6D C6E C6F C6G C6H C42 C46 C75 CLIP1 CLIP2 CLIP3 CLIP4 CLIP5 CLIP6 CLIP7 CLIP8 CLIP9 CLIP10 CLIP11 CLIP12 CLIP13 CLIP14 CLIP15 CLIP16 CLIP17 CLIP18 IC23 IC24 IC30 IC34 R1A R1B R1C R1D R1E R1F R1G R1H R8A R8B R8C R8D R8E R8F R8G R8H R41 R42 R56 R86 T_IC3 T_IC5